# Altium schematic sheet Top-Sheet.SchDoc
size 420 x 297 mm; SheetNumber: 1; SheetTotal: 7
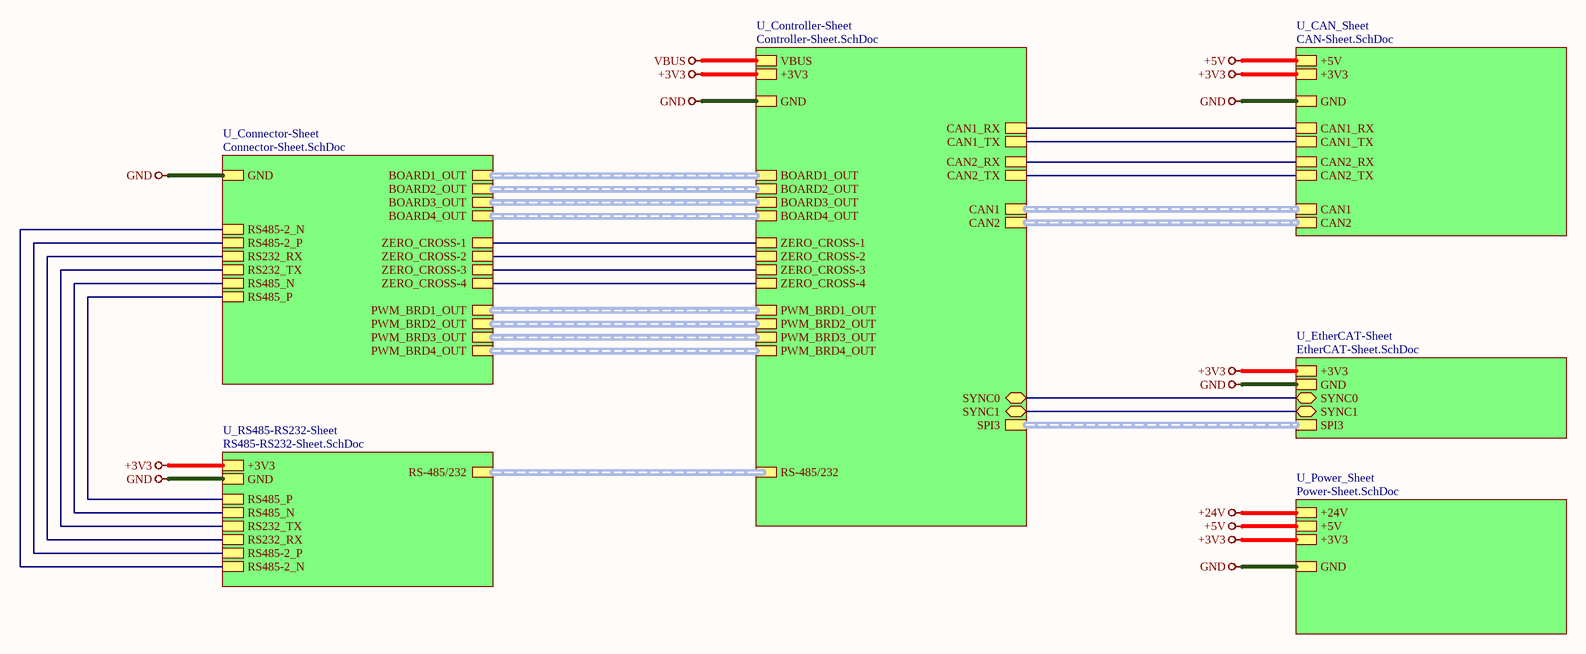
[diagram p0: Top-Sheet.SchDoc]

## Sub-sheets
U_CAN_Sheet = CAN-Sheet.SchDoc: CAN1 (harness CAN), CAN1_RX, CAN1_TX, +5V, +3V3, GND, CAN2 (harness CAN), CAN2_RX, CAN2_TX
U_Connector-Sheet = Connector-Sheet.SchDoc: BOARD1_OUT (harness BOARD1_OUT), BOARD2_OUT (harness BOARD2_OUT), BOARD3_OUT (harness BOARD3_OUT), BOARD4_OUT (harness BOARD4_OUT), RS485-2_N, RS485-2_P, RS232_RX, RS232_TX, RS485_N, RS485_P, PWM_BRD1_OUT (harness PWM_BRD1_OUT), PWM_BRD2_OUT (harness PWM_BRD2_OUT), PWM_BRD3_OUT (harness PWM_BRD3_OUT), PWM_BRD4_OUT (harness PWM_BRD4_OUT), ZERO_CROSS-1, GND, ZERO_CROSS-2, ZERO_CROSS-3, ZERO_CROSS-4
U_Controller-Sheet = Controller-Sheet.SchDoc: CAN1 (harness CAN1), CAN2_RX, CAN2_TX, VBUS, +3V3, GND, CAN1_RX, CAN1_TX, CAN2 (harness CAN2), SYNC0 (bidir), SYNC1 (bidir), SPI3 (harness SPI3), RS-485/232 (harness RS-485/232), BOARD1_OUT (harness BOARD1_OUT), BOARD2_OUT (harness BOARD2_OUT), BOARD3_OUT (harness BOARD3_OUT), BOARD4_OUT (harness BOARD4_OUT), PWM_BRD1_OUT (harness PWM_BRD1_OUT), PWM_BRD2_OUT (harness PWM_BRD2_OUT), PWM_BRD3_OUT (harness PWM_BRD3_OUT), PWM_BRD4_OUT (harness PWM_BRD4_OUT), ZERO_CROSS-1, ZERO_CROSS-2, ZERO_CROSS-3, ZERO_CROSS-4
U_EtherCAT-Sheet = EtherCAT-Sheet.SchDoc: +3V3, GND, SYNC0 (bidir), SYNC1 (bidir), SPI3 (harness SPI3)
U_Power_Sheet = Power-Sheet.SchDoc: +24V, +5V, +3V3, GND
U_RS485-RS232-Sheet = RS485-RS232-Sheet.SchDoc: RS485-2_N, RS485-2_P, RS232_RX, RS232_TX, RS-485/232 (harness RS-485/232), +3V3, GND, RS485_N, RS485_P

## Nets
+3V3: sheet U_CAN_Sheet/+3V3, sheet U_Power_Sheet/+3V3, sheet U_Controller-Sheet/+3V3, sheet U_RS485-RS232-Sheet/+3V3, sheet U_EtherCAT-Sheet/+3V3
+5V: sheet U_CAN_Sheet/+5V, sheet U_Power_Sheet/+5V
+24V: sheet U_Power_Sheet/+24V
GND: sheet U_CAN_Sheet/GND, sheet U_Power_Sheet/GND, sheet U_Connector-Sheet/GND, sheet U_Controller-Sheet/GND, sheet U_RS485-RS232-Sheet/GND, sheet U_EtherCAT-Sheet/GND
VBUS: sheet U_Controller-Sheet/VBUS
(unnamed): sheet U_CAN_Sheet/CAN1_RX, sheet U_Controller-Sheet/CAN1_RX
(unnamed): sheet U_CAN_Sheet/CAN1_TX, sheet U_Controller-Sheet/CAN1_TX
(unnamed): sheet U_CAN_Sheet/CAN2_RX, sheet U_Controller-Sheet/CAN2_RX
(unnamed): sheet U_CAN_Sheet/CAN2_TX, sheet U_Controller-Sheet/CAN2_TX
(unnamed): sheet U_Connector-Sheet/RS485-2_N, sheet U_RS485-RS232-Sheet/RS485-2_N
(unnamed): sheet U_Connector-Sheet/RS485-2_P, sheet U_RS485-RS232-Sheet/RS485-2_P
(unnamed): sheet U_Connector-Sheet/RS232_RX, sheet U_RS485-RS232-Sheet/RS232_RX
(unnamed): sheet U_Connector-Sheet/RS232_TX, sheet U_RS485-RS232-Sheet/RS232_TX
(unnamed): sheet U_Connector-Sheet/RS485_N, sheet U_RS485-RS232-Sheet/RS485_N
(unnamed): sheet U_Connector-Sheet/RS485_P, sheet U_RS485-RS232-Sheet/RS485_P
(unnamed): sheet U_Connector-Sheet/ZERO_CROSS-1, sheet U_Controller-Sheet/ZERO_CROSS-1
(unnamed): sheet U_Connector-Sheet/ZERO_CROSS-2, sheet U_Controller-Sheet/ZERO_CROSS-2
(unnamed): sheet U_Connector-Sheet/ZERO_CROSS-3, sheet U_Controller-Sheet/ZERO_CROSS-3
(unnamed): sheet U_Connector-Sheet/ZERO_CROSS-4, sheet U_Controller-Sheet/ZERO_CROSS-4
(unnamed): sheet U_Controller-Sheet/SYNC0, sheet U_EtherCAT-Sheet/SYNC0
(unnamed): sheet U_Controller-Sheet/SYNC1, sheet U_EtherCAT-Sheet/SYNC1

## Buses and harness runs
harness sheet U_CAN_Sheet/CAN1 = sheet U_Controller-Sheet/CAN1
harness sheet U_CAN_Sheet/CAN2 = sheet U_Controller-Sheet/CAN2
harness sheet U_Connector-Sheet/BOARD1_OUT = sheet U_Controller-Sheet/BOARD1_OUT
harness sheet U_Connector-Sheet/BOARD2_OUT = sheet U_Controller-Sheet/BOARD2_OUT
harness sheet U_Connector-Sheet/BOARD3_OUT = sheet U_Controller-Sheet/BOARD3_OUT
harness sheet U_Connector-Sheet/BOARD4_OUT = sheet U_Controller-Sheet/BOARD4_OUT
harness sheet U_Connector-Sheet/PWM_BRD1_OUT = sheet U_Controller-Sheet/PWM_BRD1_OUT
harness sheet U_Connector-Sheet/PWM_BRD2_OUT = sheet U_Controller-Sheet/PWM_BRD2_OUT
harness sheet U_Connector-Sheet/PWM_BRD3_OUT = sheet U_Controller-Sheet/PWM_BRD3_OUT
harness sheet U_Connector-Sheet/PWM_BRD4_OUT = sheet U_Controller-Sheet/PWM_BRD4_OUT
harness sheet U_Controller-Sheet/RS-485/232 = sheet U_RS485-RS232-Sheet/RS-485/232
harness sheet U_Controller-Sheet/SPI3 = sheet U_EtherCAT-Sheet/SPI3

## Notes on the sheet
- File:
- Title:
- Date:
- Page
- Num:
- Total:
- Drawn By: Huzaifa Ali